# EAGLE design Multiplatform CVBS Processor (EAGLE 4.11)
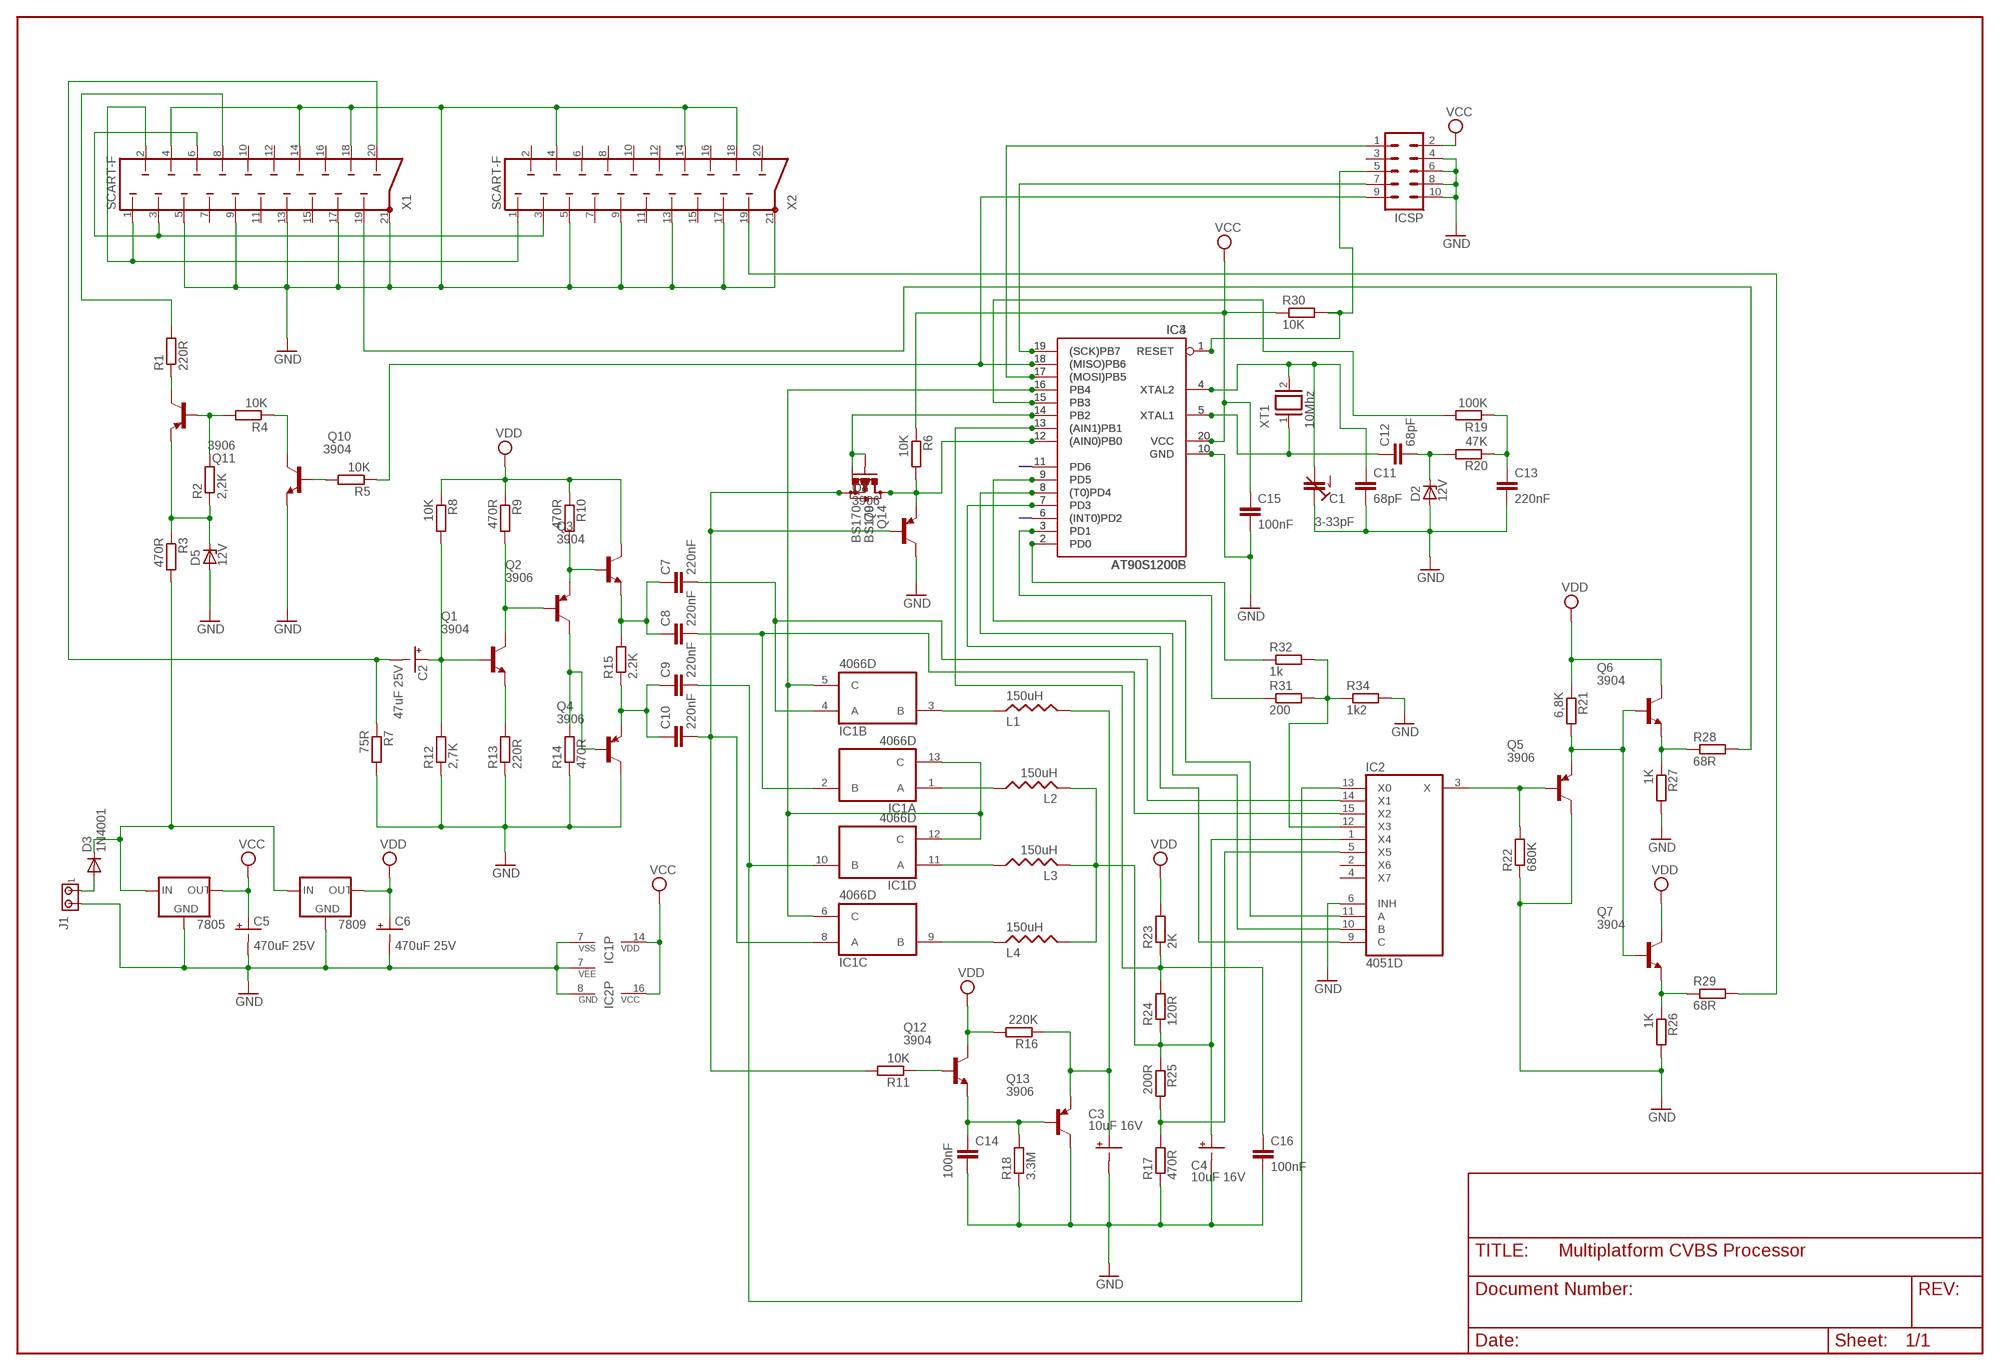
[diagram p0: schematic, sheet 1]

## Parts
7805  78XXS  [78XXS]
7809  78XXS  [78XXS]
C1  3-33pF  C-TRIMM808  [CTRIM808-BC]
C2  47uF 25V  CPOL-USE2-5  [E2-5]
C3  10uF 16V  CPOL-USE2-5  [E2-5]
C4  10uF 16V  CPOL-USE2-5  [E2-5]
C5  470uF 25V  CPOL-USE3.5-10  [E3,5-10]
C6  470uF 25V  CPOL-USE3.5-10  [E3,5-10]
C7  220nF  C-EUC1206K  [C1206K]
C8  220nF  C-EUC1206K  [C1206K]
C9  220nF  C-EUC1206K  [C1206K]
C10  220nF  C-EUC1206K  [C1206K]
C11  68pF  C-EUC1206K  [C1206K]
C12  68pF  C-EUC1206K  [C1206K]
C13  220nF  C-EUC1206K  [C1206K]
C14  100nF  C-EUC1206K  [C1206K]
C15  100nF  C-EUC1206K  [C1206K]
C16  100nF  C-EUC1206K  [C1206K]
D2  12V  BZX84CSMD  [TO236]
D3  1N4001  1N4446  [DO35-10]
D5  12V  BZX84CSMD  [TO236]
IC1  4066D  [SO14]
IC2  4051D  [SO16]
IC3  AT90S1200P  [DIL20]
IC4  AT90S1200S  [SO20L]
ICSP  MA05-2  [MA05-2]
J1  MTA02-156  [1X2MTA]
L1  150uH  L-US0204V  [0204V]
L2  150uH  L-US0204V  [0204V]
L3  150uH  L-US0204V  [0204V]
L4  150uH  L-US0204V  [0204V]
Q1  3904  MMBT3904LT1-NPN-SOT23-BEC  [SOT23-BEC]
Q2  3906  MMBT3906LT1SMD  [SOT23-BEC]
Q3  3904  MMBT3904LT1-NPN-SOT23-BEC  [SOT23-BEC]
Q4  3906  MMBT3906LT1SMD  [SOT23-BEC]
Q5  3906  MMBT3906LT1SMD  [SOT23-BEC]
Q6  3904  MMBT3904LT1-NPN-SOT23-BEC  [SOT23-BEC]
Q7  3904  MMBT3904LT1-NPN-SOT23-BEC  [SOT23-BEC]
Q8  3906  MMBT3906LT1SMD  [SOT23-BEC]
Q9  BS170  BSS123  [SOT23]
Q10  3904  MMBT3904LT1-NPN-SOT23-BEC  [SOT23-BEC]
Q11  3906  MMBT3906LT1SMD  [SOT23-BEC]
Q12  3904  MMBT3904LT1-NPN-SOT23-BEC  [SOT23-BEC]
Q13  3906  MMBT3906LT1SMD  [SOT23-BEC]
Q14  BS170  [SOT54E]
R1  220R  R-EU_R0805W  [R0805W]
R2  2,2K  R-EU_R0805W  [R0805W]
R3  470R  R-EU_R0805W  [R0805W]
R4  10K  R-EU_R0805W  [R0805W]
R5  10K  R-EU_R0805W  [R0805W]
R6  10K  R-EU_R0805W  [R0805W]
R7  75R  R-EU_R0805W  [R0805W]
R8  10K  R-EU_R0805W  [R0805W]
R9  470R  R-EU_R0805W  [R0805W]
R10  470R  R-EU_R0805W  [R0805W]
R11  10K  R-EU_R0805W  [R0805W]
R12  2,7K  R-EU_R0805W  [R0805W]
R13  220R  R-EU_R0805W  [R0805W]
R14  470R  R-EU_R0805W  [R0805W]
R15  2.2K  R-EU_R0805W  [R0805W]
R16  220K  R-EU_R0805W  [R0805W]
R17  470R  R-EU_R0805W  [R0805W]
R18  3.3M  R-EU_R0805W  [R0805W]
R19  100K  R-EU_R0805W  [R0805W]
R20  47K  R-EU_R0805W  [R0805W]
R21  6,8K  R-EU_R0805W  [R0805W]
R22  680K  R-EU_R0805W  [R0805W]
R23  2K  R-EU_R0805W  [R0805W]
R24  120R  R-EU_R0805W  [R0805W]
R25  200R  R-EU_R0805W  [R0805W]
R26  1K  R-EU_R0805W  [R0805W]
R27  1K  R-EU_R0805W  [R0805W]
R28  68R  R-EU_R0805W  [R0805W]
R29  68R  R-EU_R0805W  [R0805W]
R30  10K  R-EU_R0805W  [R0805W]
R31  200  R-EU_R0805W  [R0805W]
R32  1k  R-EU_R0805W  [R0805W]
R34  1k2  R-EU_R0805W  [R0805W]
X1  SCART-F  [SCART-F]
X2  SCART-F  [SCART-F]
XT1  10Mhz  XTAL/S  [QS]

## Nets
GND: 7805.GND 7809.GND C1.1(E) C3.- C4.- C5.- C6.- C11.2 C13.2 C14.2 C15.2 C16.2 D2.A D5.A IC1.7(P:VSS) IC2.6(INH) IC2.7(VEE) IC2.8(GND) IC3.10(GND) IC4.10(GND) ICSP.4 ICSP.6 ICSP.8 ICSP.10 J1.2 Q4.C Q5.C Q8.C Q10.E Q13.C R7.2 R12.1 R13.1 R14.1 R17.1 R18.1 R22.1 R26.2 R27.2 R34.2 X1.4 X1.5 X1.9 X1.13 X1.14 X1.17 X1.18 X1.21 X2.4 X2.5 X2.9 X2.13 X2.14 X2.17 X2.18 X2.21
N$1: X1.1 X1.2 X2.1
N$2: C3.+ L1.1 Q13.E R16.1
N$3: X1.3 X1.6 X2.3
N$4: Q2.C Q4.B R14.2
N$5: R1.2 X1.8
N$6: Q11.C R1.1
N$7: Q1.E R13.2
N$8: Q11.B R2.2 R4.2
N$9: Q6.E R27.1 R28.1
N$10: D5.C Q11.E R2.1 R3.1
N$11: C16.1 IC3.13((AIN1)PB1) IC4.13((AIN1)PB1) R23.1 R24.2
N$12: IC2.9(C) IC3.7(PD3) IC4.7(PD3)
N$13: Q10.C R4.1
N$14: Q10.B R5.2
N$15: IC3.18((MISO)PB6) IC4.18((MISO)PB6) ICSP.9 R5.1
N$16: IC3.14(PB2) IC4.14(PB2) Q9.1(G) Q14.G
N$17: IC2.5(X5) R17.2 R25.2
N$18: C8.2 IC1.2(A:B) IC2.15(X2)
N$19: C7.2 IC1.4(B:A) IC2.14(X1)
N$20: C2.+ Q1.B R8.2 R12.2
N$21: IC3.12((AIN0)PB0) IC4.12((AIN0)PB0) Q8.E Q9.3(D) Q14.D R6.2
N$22: C2.- R7.1 X1.20
N$23: IC2.10(B) IC3.8((T0)PD4) IC4.8((T0)PD4)
N$24: IC2.11(A) IC3.9(PD5) IC4.9(PD5)
N$25: Q7.E R26.1 R29.1
N$26: C9.2 IC1.10(D:B) IC2.13(X0)
N$27: R29.2 X2.19
N$28: Q5.E Q6.B Q7.B R21.2
N$29: Q2.E Q3.B R10.2
N$30: IC2.3(X) Q5.B R22.2
N$31: Q1.C Q2.B R9.2
N$32: D3.A J1.1
N$34: 7805.IN 7809.IN D3.C R3.2
N$37: C7.1 C8.1 Q3.E R15.2
N$38: C9.1 C10.1 Q4.E R15.1
N$41: R28.2 X1.19
N$42: IC3.1(RESET) IC4.1(RESET) ICSP.5 R30.2
N$43: IC1.5(B:C) IC1.6(C:C) IC1.12(D:C) IC1.13(A:C) IC3.16(PB4) IC4.16(PB4)
N$44: IC3.17((MOSI)PB5) IC4.17((MOSI)PB5) ICSP.1
N$45: IC3.19((SCK)PB7) IC4.19((SCK)PB7) ICSP.7
N$46: IC1.3(B:B) L1.2
N$47: IC1.9(C:B) L4.2
N$48: IC1.11(D:A) L3.1
N$49: IC1.1(A:A) L2.1
N$50: C4.+ IC2.1(X4) L2.2 L3.2 L4.1 R24.1 R25.1
N$51: IC3.2(PD0) IC4.2(PD0) R32.1
N$52: Q12.B R11.1
N$53: C10.2 IC1.8(C:A) Q8.B Q9.2(S) Q14.S R11.2
N$54: IC3.3(PD1) IC4.3(PD1) R31.1
N$55: IC3.15(PB3) IC4.15(PB3) R19.2
N$56: C13.1 R19.1 R20.1
N$57: IC3.11(PD6) IC4.11(PD6)
N$58: C12.2 D2.C R20.2
N$59: C12.1 IC3.5(XTAL1) IC4.5(XTAL1) XT1.1
N$60: C1.2(A) C11.1 IC3.4(XTAL2) IC4.4(XTAL2) XT1.2
N$61: IC2.12(X3) R31.2 R32.2 R34.1
N$62: IC3.6((INT0)PD2) IC4.6((INT0)PD2)
N$68: C14.1 Q12.E Q13.B R18.2
VCC: 7805.OUT C5.+ C15.1 IC1.14(P:VDD) IC2.16(VCC) IC3.20(VCC) IC4.20(VCC) ICSP.2 R6.1 R30.1
VDD: 7809.OUT C6.+ Q3.C Q6.C Q7.C Q12.C R8.1 R9.1 R10.1 R16.2 R21.1 R23.2
Unconnected: IC2.2(X6) IC2.4(X7) ICSP.3 X1.7 X1.10 X1.11 X1.12 X1.15 X1.16 X2.2 X2.6 X2.7 X2.8 X2.10 X2.11 X2.12 X2.15 X2.16 X2.20

## Buses
B$1
B$2

## Library data of the parts
7805 7809 = v-reg:78XXS: VOLTAGE REGULATOR
C1 = rcl:C-TRIMM: Trimm capacitor
C2-C6 = rcl:CPOL-US: POLARIZED CAPACITOR, American symbol
C7-C16 = rcl:C-EU: CAPACITOR, European symbol
D2 D5 = diode:BZX84CSMD: Z DIODE
D3 = diode:1N4446: DIODE high speed (Philips)
IC1 = 40xx:4066: Quad bilateral ANALOG SWITCH
IC2 = 40xx:4051: 8-channel ANALOG MULTIPLEXER
IC3 IC4 = atmel:AT90S1200: MICROCONTROLLER 1 Kbytes FLASH 64 bytes EEPROM
ICSP = con-lstb:MA05-2: PIN HEADER
J1 = con-amp:MTA02-156: AMP connector
L1-L4 = rcl:L-US: INDUCTOR, American symbol
Q1 Q3 Q6 Q7 Q10 Q12 = transistor:*-NPN-: NPN Transistror
Q2 Q4 Q5 Q8 Q11 Q13 = transistor-pnp:MMBT3906*: PNP Transistror
Q9 = transistor-small-signal:BSS123: N-CHANNEL MOS FET
Q14 = transistor-small-signal:BS170: N-CHANNEL MOS FET
R1-R32 R34 = rcl:R-EU_: RESISTOR, European symbol
X1 X2 = con-hirschmann:SCART-F: TV SCART CONNECTOR
XT1 = special:XTAL/S: CRYSTAL

## Net classes
0 default: width 0.5 mm, drill 0.3 mm

## Board
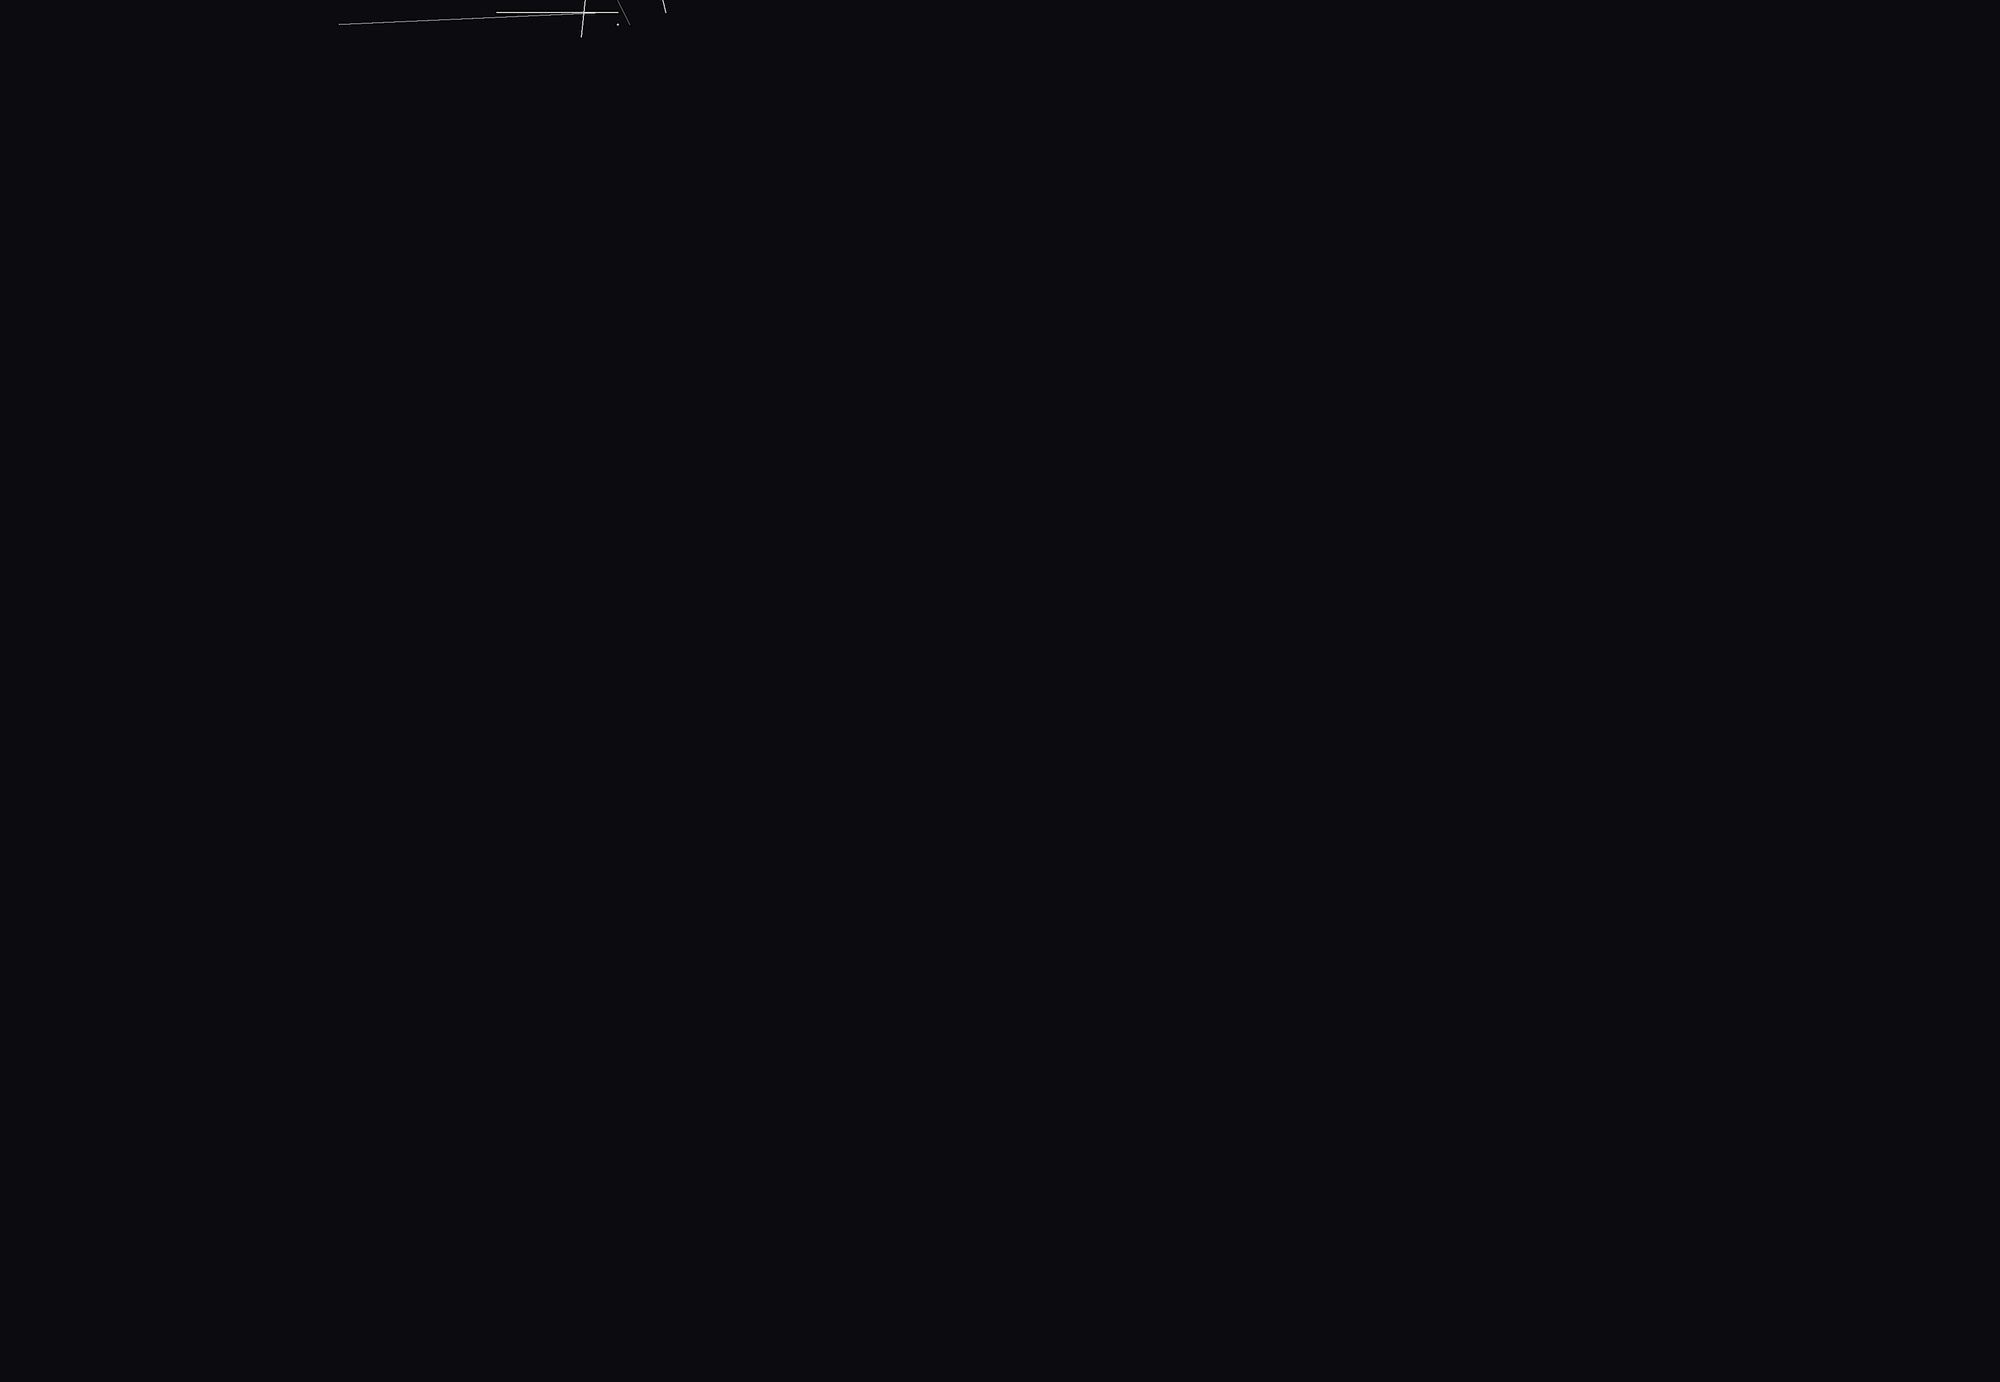
[diagram p1: board, top side]
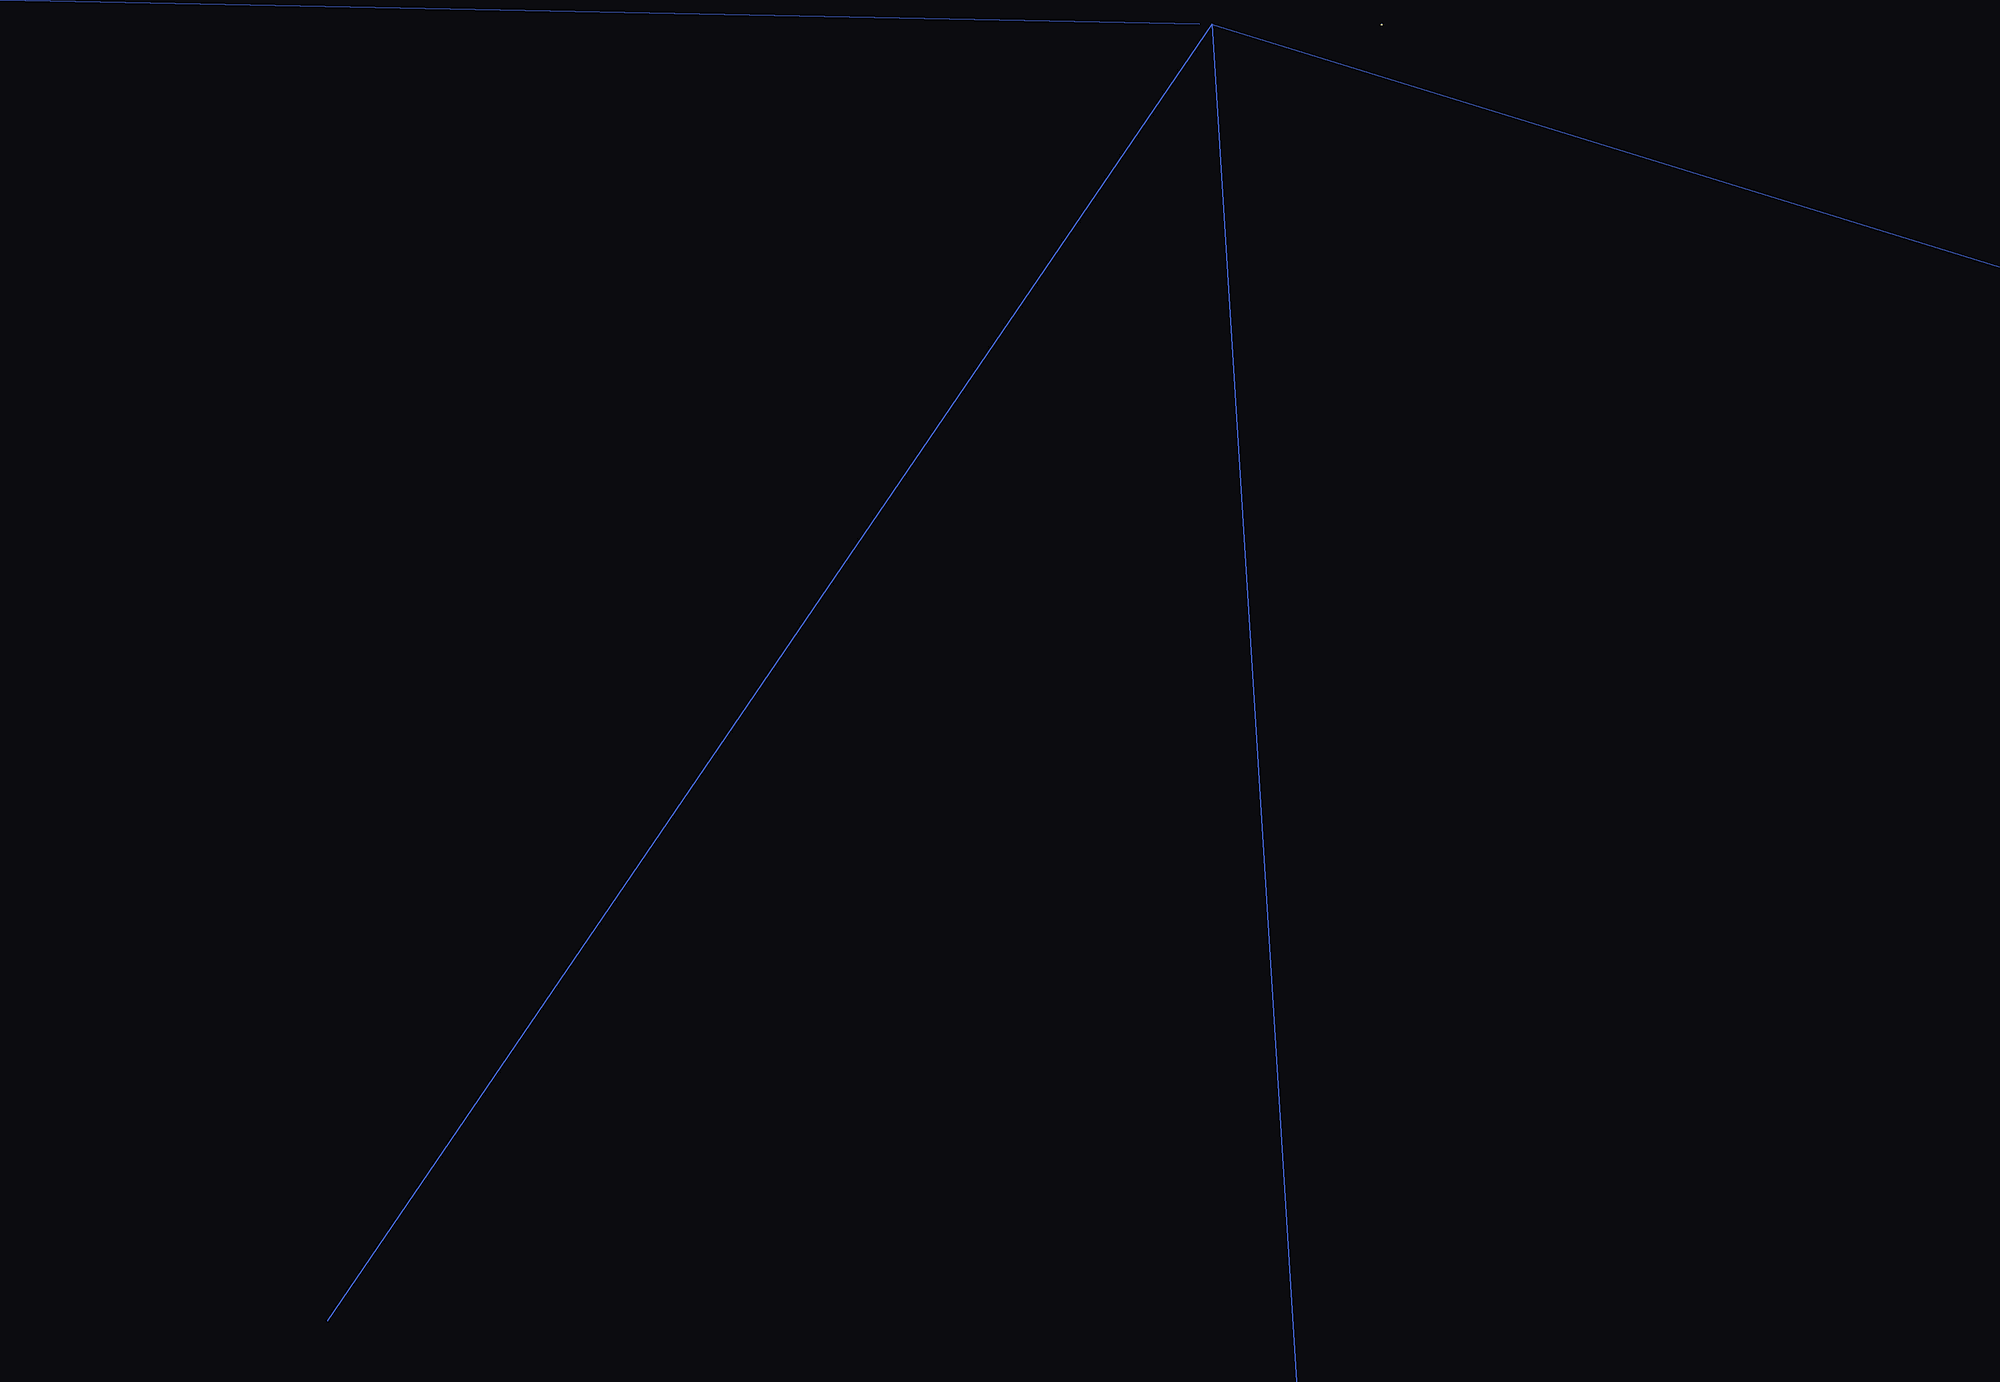
[diagram p2: board, bottom side, seen from below]

Size 70.68 x 88.87 mm. Coordinates in mm from the lower left corner, seen from the top.
Outline: 0.07,0 70.68,0.04 70.59,88.87 0,88.87 0.07,0
Copper layers (1*16): Top 0.035mm / dielectric 1.5mm / Bottom 0.035mm
Design rules "10mils": minimum track width 10mil, minimum drill 24mil, track to track 10mil, track to pad 10mil, pad to pad 10mil, via to via 10mil, smd to smd 10mil, copper to edge 40mil, drill to drill 10mil, minimum pad ring 10mil, minimum via ring 8mil, stop-mask expansion 0mil, vias tented up to drill 0mil, thermal gap 10mil
Holes 3.81 mm at 6.08,58.02 64.5,58.02
Holes 6.45 mm at 6.04,5.58 64.31,5.62
vRestrict: area 42.1,24.6 to 52.5,29.4

### Footprints (pad centres in the part's own frame; a part is rotated, then mirrored left to right if it is on the bottom)
78XXS = drill 1.016 long: GND 0,-2.54; IN -2.54,-2.54; OUT 2.54,-2.54
CTRIM808-BC = drill 1.3 round: 1 -3.607,0; 2 0,3.607; 3 3.607,0
E2-5 = drill 0.813 pad 1.27 round: + -1.016,0 | drill 0.813 pad 1.27 octagon: - 1.016,0
E3,5-10 = drill 0.813 pad 1.6 round: + -1.778,0 | drill 0.813 pad 1.6 octagon: - 1.778,0
C1206K = smd 1.5 x 2: 1 -1.5,0; 2 1.5,0
TO236 = smd 1 x 1.2: A -1,-1; C 0,1; NC 1,-1
DO35-10 = drill 0.813 long: A 5.08,0; C -5.08,0
SO14 = smd 0.66 x 2.032: 1 -3.81,-3.073; 2 -2.54,-3.073; 3 -1.27,-3.073; 4 0,-3.073; 5 1.27,-3.073; 6 2.54,-3.073; 7 3.81,-3.073; 8 3.81,3.073; 9 2.54,3.073; 10 1.27,3.073; 11 0,3.073; 12 -1.27,3.073; 13 -2.54,3.073; 14 -3.81,3.073
SO16 = smd 0.66 x 2.032: 1 -4.445,-3.073; 2 -3.175,-3.073; 3 -1.905,-3.073; 4 -0.635,-3.073; 5 0.635,-3.073; 6 1.905,-3.073; 7 3.175,-3.073; 8 4.445,-3.073; 9 4.445,3.073; 10 3.175,3.073; 11 1.905,3.073; 12 0.635,3.073; 13 -0.635,3.073; 14 -1.905,3.073; 15 -3.175,3.073; 16 -4.445,3.073
DIL20 = drill 0.813 long: 1 -11.43,-3.81; 2 -8.89,-3.81; 3 -6.35,-3.81; 4 -3.81,-3.81; 5 -1.27,-3.81; 6 1.27,-3.81; 7 3.81,-3.81; 8 6.35,-3.81; 9 8.89,-3.81; 10 11.43,-3.81; 11 11.43,3.81; 12 8.89,3.81; 13 6.35,3.81; 14 3.81,3.81; 15 1.27,3.81; 16 -1.27,3.81; 17 -3.81,3.81; 18 -6.35,3.81; 19 -8.89,3.81; 20 -11.43,3.81
SO20L = smd 0.762 x 1.143: 1 -5.08,-5.131; 2 -3.81,-5.131; 3 -2.54,-5.131; 4 -1.27,-5.131; 5 0,-5.131; 6 1.27,-5.131; 7 2.54,-5.131; 8 3.81,-5.131; 9 5.08,-5.131; 10 6.35,-5.131; 11 6.35,4.369; 12 5.08,4.394; 13 3.81,4.394; 14 2.54,4.394; 15 1.27,4.394; 16 0,4.394; 17 -1.27,4.394; 18 -2.54,4.394; 19 -3.81,4.394; 20 -5.08,4.394
MA05-2 = drill 1.016 octagon: 1 -5.08,-1.27; 2 -5.08,1.27; 3 -2.54,-1.27; 4 -2.54,1.27; 5 0,-1.27; 6 0,1.27; 7 2.54,-1.27; 8 2.54,1.27; 9 5.08,-1.27; 10 5.08,1.27
1X2MTA = drill 1.676 long: 1 1.981,0; 2 -1.981,0
0204V = drill 0.813 octagon: 1 -1.27,0; 2 1.27,0
SOT23-BEC = smd 1 x 1.4: B -0.95,-1.1; C 0,1.1; E 0.95,-1.1
SOT23 = smd 1 x 1.4: 1 -0.95,-1.1; 2 0.95,-1.1; 3 0,1.1
SOT54E = drill 0.813 octagon: D -1.27,0; G 0,1.905; S 1.27,0
R0805W = smd 1.5 x 1: 1 -0.94,0; 2 0.94,0
SCART-F = drill 1.321 long: 1 19.05,3.81; 2 17.145,-1.27; 3 15.24,3.81; 4 13.335,-1.27; 5 11.43,3.81; 6 9.525,-1.27; 7 7.62,3.81; 8 5.715,-1.27; 9 3.81,3.81; 10 1.905,-1.27; 11 0,3.81; 12 -1.905,-1.27; 13 -3.81,3.81; 14 -5.715,-1.27; 15 -7.62,3.81; 16 -9.525,-1.27; 17 -11.43,3.81; 18 -13.335,-1.27; 19 -15.24,3.81; 20 -17.145,-1.27; 21 -19.05,3.81
QS = drill 0.61 round: 1 -2.54,0; 2 2.54,0

### Placement (x,y rotation side)
7805  14.32,10.12 0 top
7809  14.28,17.62 0 top
C1  64.98,27.47 90 top
C2  56.24,84.05 90 top
C3  22.56,26.81 180 top
C4  22.45,20.79 0 top
C5  31.02,24.14 90 top
C6  7.49,26.96 180 top
C7  47.35,63.73 90 top
C8  44.18,63.73 90 top
C9  47.35,55.16 90 top
C10  44.18,55.16 90 top
C11  55.42,27.04 0 top
C12  39.53,26.96 180 top
C13  65.77,16 180 top
C14  38.66,32.8 270 top
C15  65.77,19.81 180 top
C16  30.52,16.36 270 top
D2  65.58,36.36 0 top
D3  21.09,10.7 270 top
D5  7.04,84 0 top
IC1  35.29,63.1 0 top
IC2  34.65,52.94 0 top
IC3  49.26,18.78 180 top
IC4  49.99,14.2 180 top
ICSP  49.46,6.16 180 top
J1  29.52,7.73 180 top
L1  16.87,60.08 0 top
L2  17,55.83 180 top
L3  17,52.66 180 top
L4  16.87,63.25 0 top
Q1  54.34,61.83 270 top
Q2  54.34,55.16 90 top
Q3  57.51,50.08 270 top
Q4  51.8,50.08 90 top
Q5  35.29,84.05 0 top
Q6  42.91,84.05 0 top
Q7  61.32,84.05 0 top
Q8  27,16.19 0 top
Q9  38.57,8.49 90 top
Q10  14.2,84.22 0 top
Q11  24.49,84.05 0 top
Q12  42.47,33.01 0 top
Q13  31.92,32.8 0 top
Q14  38.86,3.7 0 top
R1  28.3,84.05 270 top
R2  20.63,84.1 270 top
R3  3.54,84.05 270 top
R4  17.65,84.1 270 top
R5  10.39,84.14 90 top
R6  25.92,32.79 270 top
R7  51.8,84.05 270 top
R8  57.51,65.64 180 top
R9  58.78,61.83 270 top
R10  58.78,55.16 270 top
R11  45.65,32.8 90 top
R12  51.8,65.64 0 top
R13  50.52,61.83 270 top
R14  50.52,55.16 270 top
R15  45.45,50.08 180 top
R16  28.51,32.8 90 top
R17  55.81,32.8 90 top
R18  35.49,32.8 90 top
R19  65.77,12.32 180 top
R20  61.88,36.42 90 top
R21  39.09,84.05 270 top
R22  31.73,84.05 270 top
R23  48.19,32.8 90 top
R24  50.73,32.8 90 top
R25  53.27,32.8 90 top
R26  64.5,84.05 270 top
R27  49.26,84.05 270 top
R28  46.72,84.05 270 top
R29  67.03,84.05 270 top
R30  57.27,6.03 90 top
R31  17.89,32.6 90 top
R32  23.35,32.81 270 top
R34  20.37,32.69 90 top
X1  35.29,74.53 180 bottom
X2  35.29,44.05 180 bottom
XT1  47.33,27.06 0 top

### Tracks (layer width: path | path; a pad name or v marks a point on that pad's centre or on a via)
GND  (via drill 0.61)
  Top 0.406: IC3.10 37.82,20.88 39.31,19.39 43.58,19.39 43.64,19.45 | 43.64,19.45 43.67,19.48 | 43.64,19.45 IC4.10
  Top 0.5: v8.3,24.03 8.94,23.35 8.94,20.35 11.64,17.65 12.39,17.65 13.59,16.45 7809.GND | 7805.GND 13.89,9.25 13.89,13.45 7809.GND | 64.29,17.95 64.29,18.85 C15.2 | 64.29,17.95 64.29,16.9 C13.2 64.29,15.1 64.29,14.2 64.14,14.05 63.24,14.05 62.94,13.75 62.94,13.15 61.74,11.95 61.14,11.95 60.24,11.05 60.24,9.59 v59.01,8.44 | 64.29,17.95 68.78,17.95 68.79,18.85 68.79,22.15 v67.29,23.65 66.99,24.25 66.99,33.4 66.69,33.7 64.74,33.7 64.59,33.85 | 64.59,33.85 64.59,34.9 D2.A | 64.59,33.85 64.44,33.7 58.59,33.7 | 57.09,32.2 56.34,31.45 56.19,31.45 R17.1 | 58.59,33.7 57.09,32.2 | v56.64,29.05 57.24,28.45 57.24,28 C11.2 | 57.09,32.2 v57.39,31.9 | v25.29,19.45 25.74,19 26.79,19 26.94,18.85 26.94,17.95 Q8.C | C5.- 31.29,25.15 31.44,25 33.54,25 34.74,23.8 v34.74,23.2 35.04,22.6 35.19,22.45 35.19,18.55 v35.34,18.4 | ICSP.4 51.24,4.6 50.34,4.6 ICSP.6 48.69,4.6 47.79,4.6 ICSP.8 46.14,4.6 45.24,4.6 ICSP.10 43.89,5.65 42.69,6.85 42.69,9.55 41.49,10.75 35.94,10.75 v35.49,10.3 32.34,13.45 32.34,14.8 31.44,14.8 C16.2 | v19.66,28.33 19.27,28.06 17.92,26.71 17.92,25.42 18.54,24.84 18.54,13.45 17.79,12.7 15.84,12.7 14.94,13.6 7809.GND | 20.34,35.95 20.34,34.3 R34.2 | 20.34,35.95 23.04,38.65 X2.17 | X2.21 17.19,38.8 17.49,38.8 20.34,35.95 | X2.18 22.29,43.3 23.49,42.1 X2.17 | Q4.C 50.04,50.05 49.44,50.05 48.84,49.45 48.84,47.35 X2.4 48.22,43.8 46.74,42.07 X2.5 45.69,41.65 45.09,41.65 44.19,42.55 44.04,42.55 43.59,43 42.09,43 41.19,42.1 40.29,42.1 39.99,41.8 X2.9 | 37.89,48.1 36.54,48.1 36.54,49 IC2.6 | 37.89,48.1 37.89,49 IC2.7 | 39.09,48.1 IC2.8 | 39.09,48.1 37.89,48.1 | X2.9 39.09,48.1
  Top 0.5: C14.2 37.74,31.3 35.94,31.3 R18.1 35.04,32.05 33.84,33.25 32.34,33.25 Q13.C 31.89,34.6 v31.89,35.95 | X2.9 38.19,41.8 37.29,41.8 36.09,43 34.59,43 33.69,42.1 32.94,42.1 32.49,41.65 X2.13 30.99,42.25 29.94,43.3 X2.14 28.59,43.9 27.99,43.3 27.24,43.3 26.49,42.55 26.34,42.55 25.44,41.65 24.84,41.65 X2.17 | R27.2 49.74,82.6 51.39,82.6 R7.2 52.14,83.05 v53.34,83.05 | v54.84,79.45 55.29,79.9 60.54,79.9 60.99,80.35 63.84,80.35 64.44,80.95 64.44,82.45 R26.2 | R13.1 50.49,63.4 50.49,65.2 R12.1 | v51.09,59.05 51.09,57.55 50.49,56.95 50.49,56.8 R14.1 | R12.1 50.19,65.65 49.29,65.65 49.14,65.8 49.14,66.55 47.04,68.65 X1.5 47.19,72.7 48.24,73.75 X1.4 | v52.29,68.5 52.29,67.9 51.09,66.7 51.09,66.1 R12.1 | v9.09,80.8 6.24,80.8 6.09,80.95 6.09,82.45 D5.A | v11.79,80.8 14.94,80.8 15.09,80.95 | 15.09,80.95 15.09,82.45 Q10.E | X1.21 17.19,72.25 17.94,72.25 18.84,73.15 18.99,73.15 20.19,74.35 20.94,74.35 X1.18 | X1.18 22.29,73.75 23.34,72.7 X1.17 24.84,72.1 25.44,72.1 27.24,73.9 28.14,73.9 28.59,74.35 X1.14 | 15.09,80.95 15.24,80.8 17.34,80.8 20.94,77.2 X1.18 | v40.74,62.5 40.14,62.5 39.24,61.6 39.09,61.6 IC1.7 | R22.1 31.74,85.6 31.74,86.35 35.34,86.35 35.34,85.75 Q5.C 35.64,84.55 37.14,84.55 37.44,84.25 37.44,81.25 36.39,80.2 32.64,80.2 30.09,77.65 X1.14 | X1.14 29.94,73.75 30.99,72.7 X1.13 32.49,72.1 32.94,72.55 33.54,72.55 34.44,73.45 36.09,73.45 37.29,72.25 38.19,72.25 X1.9 | v12.69,41.05 9.99,41.05 7.44,43.6 7.44,46.45 9.54,48.55 9.54,53.95 10.49,54.9 10.54,63.95 v13.89,67.3 | v61.14,41.8 57.99,38.65 57.99,37 58.44,36.55 58.44,33.85 58.59,33.7
  Bottom 0.5: v8.3,24.03 6.57,24.05 C6.- | v67.29,23.65 65.4,23.73 64.98,23.98 C1.1 | v56.64,29.05 57.09,29.5 57.09,31.6 v57.39,31.9 | v25.29,19.45 24.24,20.5 C4.- | C4.- 23.19,21.55 23.19,22 21.84,23.35 21.84,26.05 C3.- 20.79,27.1 20.04,27.85 v19.66,28.33 | C5.- 30.24,25.6 28.59,25.6 24.09,21.1 C4.- | v34.74,23.2 37.14,23.2 IC3.10 | v35.49,10.3 33.39,10.3 32.64,9.55 J1.2 30.84,10 29.64,11.2 29.64,12.25 30.54,13.15 30.69,13.15 35.34,17.8 v35.34,18.4 | v59.01,8.44 60.24,7.6 60.24,4.9 57.99,2.65 53.34,2.65 52.44,3.55 52.44,4.15 ICSP.4 | v31.89,35.95 31.89,38.2 X2.13 | v53.34,83.05 53.34,82.75 54.84,81.25 v54.84,79.45 55.14,78.85 55.29,78.7 55.29,75.1 52.29,72.1 v52.29,68.5 | v11.79,80.8 v9.09,80.8 | v40.74,62.5 40.74,65.35 39.39,66.7 39.39,68.05 | 39.39,68.05 39.39,68.65 X1.9 | 39.39,68.05 43.89,68.05 45.09,69.25 45.69,69.25 X1.5 47.04,68.65 51.09,64.6 v51.09,59.05 51.39,58.6 57.39,52.6 57.39,52 58.29,51.1 58.29,47.35 60.69,44.95 60.69,42.25 v61.14,41.8 | v12.69,41.05 15.24,41.05 X2.21 | v13.89,67.3 15.54,68.95 X1.21
N$1
  Top 0.5: X2.1 54.54,42.25 54.54,42.55 55.29,43.3 55.29,44.05 61.29,50.05 61.29,65.65 57.69,69.25 55.29,69.25 X1.1 53.94,72.55 52.74,73.75 X1.2
N$2  (via drill 0.61)
  Top 0.5: 30.99,29.2 32.64,29.2 32.79,29.35 32.79,31.15 Q13.E | 30.99,29.2 28.59,29.2 28.44,29.35 28.44,31.15 R16.1 | v30.99,29.95 30.99,29.2 | v11.79,60.55 12.24,60.1 12.24,45.1 11.64,44.5 v11.04,44.5
  Bottom 0.5: 26.64,28.45 28.14,29.95 v30.99,29.95 | 26.64,28.45 25.44,27.25 24.24,27.25 C3.+ | v11.79,60.55 12.84,61.6 12.84,62.5 15.09,64.75 18.69,64.75 19.74,63.7 19.74,62.8 18.54,61.6 16.59,61.6 15.84,60.85 L1.1 | v11.04,44.5 9.54,43 9.54,37.45 10.59,36.4 11.94,36.4 14.19,34.15 17.94,34.15 20.94,31.15 23.94,31.15 26.64,28.45
N$3  (via drill 0.61)
  Top 0.5: v54.69,45.25 54.39,44.95 54.39,43.6 54.09,43.3 53.94,43.3 53.19,42.55 52.89,42.55 51.99,41.65 51.54,41.65 X2.3 | v57.84,44.8 57.84,45.4 62.19,49.75 62.19,53.15 v62.64,53.1
  Bottom 0.5: X1.6 45.84,77.2 46.29,77.2 47.64,78.55 49.44,78.55 50.49,77.5 50.49,72.7 X1.3 50.19,68.65 50.19,67.9 54.09,64 54.09,62.65 59.99,57.15 59.99,55.65 60.99,54.9 60.99,54.02 62.04,52.97 v62.64,53.1 | v54.69,45.25 55.14,44.8 v57.84,44.8
N$4
  Top 0.5: 53.79,52.75 53.79,54.7 Q2.C | 53.79,52.75 54.39,52.15 54.39,49.75 53.79,49.15 53.49,49.15 Q4.B | R14.2 50.79,53.5 50.79,53.2 51.69,52.3 53.34,52.3 53.79,52.75
N$5  (via drill 0.61)
  Top 0.5: v27.69,80.8 28.14,80.8 28.29,80.95 28.29,82.45 R1.2 | v21.99,68.65 22.44,68.65 23.19,67.9 28.89,67.9 v29.49,68.5
  Bottom 0.5: v27.69,80.8 26.79,80.8 23.79,77.8 23.79,74.2 21.84,72.25 21.84,68.8 v21.99,68.65 | v29.49,68.5 29.49,72.25 31.44,74.2 31.44,77.35 32.94,78.85 39.54,78.85 40.59,77.8 X1.8
N$6
  Top 0.5: Q11.C 24.54,85.75 24.54,87.1 24.69,87.25 28.14,87.25 28.29,87.1 28.29,85.6 R1.1
N$7
  Top 0.5: Q1.E 52.59,60.85 50.94,60.85 R13.2
N$8
  Top 0.5: Q11.B 23.49,82.3 23.49,80.8 23.34,80.65 20.79,80.65 20.64,80.8 20.64,82.45 R2.2 20.19,82.45 18.09,82.45 R4.2
N$9
  Top 0.5: Q6.E 44.34,83.65 45.39,84.7 46.29,84.7 R28.1 46.74,85.6 46.74,87.1 46.89,87.25 49.14,87.25 49.29,87.1 49.29,85.6 R27.1
N$10  (via drill 0.61)
  Top 0.5: 6.99,87.1 6.99,85.45 D5.C | 6.99,87.1 6.84,87.25 3.69,87.25 3.54,87.1 3.54,85.6 R3.1 | v19.14,81.1 20.49,79.75 23.64,79.75 24.09,80.2 25.14,80.2 25.44,80.5 25.44,82.3 Q11.E | v22.14,84.25 21.69,84.7 21.09,84.7 R2.1 20.64,85.75 20.64,87.1 20.49,87.25 7.14,87.25 6.99,87.1
  Bottom 0.5: v19.14,81.1 19.14,81.85 21.54,84.25 v22.14,84.25
N$11  (via drill 0.61)
  Top 0.406: IC3.13 43.43,14.45 43.43,13.58 44.6,12.41 45.36,12.41 46.18,11.58 IC4.13
  Top 0.5: R23.1 48.54,32.35 48.99,32.35 50.34,33.7 R24.2 50.79,34.45 50.79,35.2 50.64,35.35 v49.59,35.35 | v36.09,12.25 34.74,12.25 33.24,13.75 33.24,16 32.19,17.05 32.19,17.65 31.89,17.95 31.44,17.95 C16.1 29.64,18.25 27.54,20.35 v26.94,20.35
  Bottom 0.5: v36.09,12.25 36.69,12.25 36.84,12.4 40.89,12.4 42.24,13.75 IC3.13 | v49.59,35.35 44.49,30.25 42.54,30.25 40.44,28.15 37.91,28.15 36.73,30.13 35.16,30.13 34.94,30.09 33.97,29.17 33.97,27.94 34.74,27.24 34.74,25.9 32.79,23.95 29.94,23.95 29.49,24.4 28.59,24.4 27.69,23.5 27.69,21.1 v26.94,20.35
N$12  (via drill 0.61)
  Top 0.406: IC4.7 47.03,19.74 47.03,20.32 45.45,21.91 IC3.7
  Top 0.5: v41.79,52.9 41.19,52.9 39.69,54.4 39.09,54.4 IC2.9 | v33.39,26.35 36.09,23.65 36.09,21.1 36.84,20.35 37.14,20.35 38.94,18.55 41.79,18.55 42.54,17.8 47.34,17.8 47.49,17.95 47.49,18.85 IC4.7
  Bottom 0.5: v41.79,52.9 41.34,53.35 39.99,53.35 35.49,48.85 34.89,48.85 34.14,48.1 32.64,48.1 31.44,46.9 31.44,43.75 29.49,41.8 29.49,38.65 28.44,37.6 27.54,37.6 26.19,36.25 26.19,34.75 29.64,31.3 31.44,31.3 32.49,30.25 32.49,27.25 v33.39,26.35
N$13
  Top 0.5: R4.1 17.64,85.75 17.64,86.35 14.19,86.35 14.19,85.9 Q10.C
N$14
  Top 0.5: R5.2 10.74,84.7 11.94,84.7 12.84,83.8 Q10.B
N$15  (via drill 0.61)
  Top 0.406: IC4.18 52.53,10.5 54.12,12.09 55.26,12.09 55.66,12.48 55.66,14.91 55.6,14.96 IC3.18
  Top 0.5: v4.8,62.67 6.87,62.67 8.57,64.37 10.44,66.25 10.44,82.45 R5.1 | v2.19,54.75 2.64,54.3 2.64,24.25 9.84,17.05 9.84,6.1 12.24,3.7 12.99,3.7 13.29,3.4 20.04,3.4 21.39,2.05 v41.46,2.05
  Bottom 0.5: ICSP.9 44.94,7.9 49.89,12.85 54.09,12.85 54.99,13.75 IC3.18 56.19,13.75 57.09,12.85 58.14,12.85 62.04,9.69 62.17,9.55 66.25,9.57 68.82,7.46 68.82,3.94 66.1,1.7 42.63,1.7 42.24,2.05 v41.46,2.05 | v2.19,54.75 2.19,61.8 2.97,62.58 v4.8,62.67
N$16
  Top 0.406: IC3.14 45.44,13.72 47.49,11.68 47.49,9.84 IC4.14
  Top 0.5: Q9.1 39.09,7.15 39.09,6.25 Q14.G
  Bottom 0.5: Q14.G 39.24,6.25 41.64,8.65 41.64,8.95 45.69,13 45.69,13.45 IC3.14
N$17  (via drill 0.61)
  Top 0.5: R25.2 53.34,34.45 53.34,35.65 53.49,35.8 53.94,35.8 54.69,35.05 55.74,35.05 55.74,34.45 R17.2 55.44,33.7 54.69,32.95 54.69,31 52.44,28.75 41.34,28.75 40.59,29.5 v39.99,29.5 | v35.34,47.5 35.34,49 IC2.5
  Bottom 0.5: v35.34,47.5 35.34,47.2 35.19,47.05 35.19,43.9 37.14,41.95 37.14,32.35 v39.99,29.5
N$18  (via drill 0.61)
  Top 0.5: IC1.2 32.79,59.05 32.79,58.75 32.64,58.75 32.04,58.15 31.59,58.15 31.44,58 31.44,56.95 IC2.15 31.44,55 31.44,54.1 31.29,53.95 v30.99,53.95 | v40.44,60.1 42.09,61.75 42.09,64.6 42.69,65.2 43.29,65.2 C8.2
  Bottom 0.5: v40.44,60.1 35.64,55.3 32.94,55.3 31.59,53.95 v30.99,53.95
N$19  (via drill 0.61)
  Top 0.5: 35.34,58 35.19,57.85 32.94,57.85 32.79,57.7 32.79,56.95 IC2.14 | 35.34,58 35.34,59.05 IC1.4 | v46.59,67 46.59,65.95 C7.2 | v46.59,60.4 42.54,60.4 40.29,58.15 35.49,58.15 35.34,58
  Bottom 0.5: v46.59,60.4 v46.59,67
N$20  (via drill 0.61)
  Top 0.5: Q1.B 52.59,63.25 52.59,65.2 R12.2 53.34,65.65 54.69,65.65 | 54.69,65.65 55.89,65.65 R8.2 | 54.69,65.65 v54.69,65.5
  Bottom 0.5: v54.69,65.5 56.19,67 56.19,82.3 C2.+
N$21  (via drill 0.61)
  Top 0.406: IC3.12 40.98,14.36 40.98,13.3 41.62,12.66 42.9,12.66 43.98,11.58 44.53,11.58 44.85,11.26 44.85,9.86 IC4.12
  Top 0.5: 37.14,6.7 37.14,4.3 Q14.D | 37.14,6.7 37.14,8.05 Q9.3 | 27.99,13 27.99,14.5 Q8.E | 27.99,13 30.39,13 30.54,13.15 31.44,13.15 34.14,10.45 34.14,7.6 35.04,6.7 37.14,6.7 | 32.64,20.2 33.99,18.85 33.99,17.65 35.04,16.6 36.54,16.6 37.14,17.2 38.64,17.2 39.69,16.15 IC3.12 | 32.64,20.2 32.49,20.35 29.94,20.35 26.64,23.65 26.64,28 25.89,28.75 25.89,31.15 R6.2 | v23.68,7.62 23.63,9.28 27.39,13 27.99,13 | v32.94,20.5 32.64,20.2
  Bottom 0.5: v23.68,7.62 23.55,10.09 22.89,10.6 21.99,11.5 21.99,12.55 22.59,13.15 22.74,13.15 24.84,15.25 26.19,15.25 26.94,16 29.34,16 32.19,18.85 32.19,19.15 32.94,19.9 v32.94,20.5
N$22  (via drill 0.61)
  Top 0.5: R7.1 51.84,85.6 v51.84,86.8 51.84,87.1 51.99,87.25 54.39,87.25 55.89,85.75 C2.- | v29.79,85 29.79,85.9 31.14,87.25 44.94,87.25 v45.39,86.8
  Bottom 0.5: v29.79,85 24.24,79.45 20.79,79.45 18.84,77.5 X1.20 | v45.39,86.8 45.84,87.25 51.39,87.25 v51.84,86.8
N$23  (via drill 0.61)
  Top 0.305: IC4.8 44.31,21.2 42.9,21.2
  Top 0.406: IC3.8 42.86,22.64 42.83,22.64 42.83,21.27 42.9,21.2
  Top 0.5: v44.19,48.4 44.04,48.4 43.14,49.3 43.14,49.75 39.39,53.5 38.04,53.5 37.89,53.65 37.89,55 IC2.10 | v58.44,42.4 59.34,43.3 61.44,43.3 v62.94,41.8 | v59.47,25.07 58.14,25 v56.94,25
  Bottom 0.5: v44.19,48.4 44.49,48.1 45.54,48.1 46.59,47.05 46.59,43.9 47.94,42.55 49.29,42.55 49.74,43 51.24,43 51.69,42.55 53.19,42.55 54.54,43.9 56.94,43.9 v58.44,42.4 | v62.94,41.8 67.74,37 67.74,31 62.88,25.47 61.59,25.48 59.79,25.48 v59.47,25.07 | v56.94,25 55.89,24.95 50.79,24.95 50.47,24.96 49.27,24.96 48.9,24.84 46.35,24.84 45.54,24.85 44.64,24.85 43.59,23.8 IC3.8
N$24  (via drill 0.61)
  Top 0.305: IC4.9 44.73,19.46 44.45,20.17 44.22,20.4 40.87,20.4 40.5,20.76 40.5,22.73
  Top 0.406: 40.5,22.74 40.5,22.73 IC3.9
  Top 0.5: v36.69,52.6 36.54,52.75 36.54,55 IC2.11 | v12.69,39.25 13.14,38.8 13.14,37.3 12.69,36.85 12.69,30.7 11.94,29.95 v11.94,20.35 | v12.84,5.05 13.59,4.3 16.89,4.3 18.94,6.17 18.94,10.93 19.89,10.91 23.25,10.91 23.61,11.71 v23.71,11.58
  Bottom 0.5: v36.69,52.6 35.79,51.7 35.79,51.55 34.89,50.65 34.29,50.65 32.94,49.3 32.64,49.3 31.44,48.1 28.89,48.1 27.54,46.75 27.54,43.6 25.74,41.8 25.74,38.65 24.69,37.6 14.34,37.6 v12.69,39.25 | v11.94,20.35 11.94,19.6 9.09,16.75 9.11,9.08 10.2,8.29 10.15,6.16 11.34,5.05 v12.84,5.05 | v23.71,11.58 23.62,12.91 25.14,14.35 26.49,14.35 27.24,15.1 29.64,15.1 33.09,18.55 33.09,18.85 34.59,20.35 38.64,20.35 39.69,21.4 IC3.9
N$25
  Top 0.5: Q7.E 62.64,83.65 62.64,84.1 63.24,84.7 64.14,84.7 R26.1 64.44,85.6 64.44,87.1 64.59,87.25 66.84,87.25 66.99,87.1 66.99,85.6 R29.1
N$26  (via drill 0.61)
  Top 0.5: v40.44,56.8 40.44,57.1 42.84,59.5 44.34,59.5 46.44,57.4 C9.2 | v33.99,53.95 33.99,55 IC2.13 | v36.54,64.15 36.54,65.2 IC1.10
  Bottom 0.5: v40.44,56.8 38.34,56.8 35.94,54.4 34.44,54.4 v33.99,53.95 33.39,54.25 33.24,54.4 31.44,52.6 30.54,52.6 29.64,53.5 29.64,56.05 35.34,61.75 37.59,61.75 38.34,62.5 38.94,62.5 39.84,63.4 39.84,64.3 38.94,65.2 37.59,65.2 v36.54,64.15
N$27  (via drill 0.61)
  Top 0.5: v63.57,51.5 67.64,54.32 67.64,59.87 65.94,61.57 64.58,61.57 63.45,62.46 63.45,66.16 57.94,71.66 57.94,77.31 58.83,78.29 65.81,78.29 66.99,79.15 66.99,82.45 R29.2
  Bottom 0.5: v63.57,51.5 61.57,51.5 59.92,53.15 59.92,54.25 58.99,54.65 58.99,56.9 53.19,62.32 53.19,63.7 48.54,68.35 48.54,72.4 47.49,73.45 45.84,73.45 45.54,73.15 43.89,73.15 43.59,73.45 42.09,73.45 41.79,73.15 40.14,73.15 39.84,73.45 38.34,73.45 38.04,73.15 36.39,73.15 36.09,73.45 34.59,73.45 33.24,72.1 33.24,69.1 30.39,66.25 26.04,66.25 25.29,67 24.39,67 22.29,64.9 22.29,55.9 21.09,54.7 21.09,53.8 21.99,52.9 23.49,52.9 23.94,53.35 24.84,53.35 25.74,52.45 25.74,51.55 22.29,48.1 21.24,48.1 20.04,46.9 X2.19
N$28  (via drill 0.61)
  Top 0.5: 40.14,80.8 41.79,80.8 | 40.14,80.8 39.24,80.8 39.09,80.95 R21.2 | 41.79,80.8 41.94,80.95 41.94,82.3 Q6.B | v31.59,81.1 36.09,81.1 36.24,81.25 36.24,82.3 Q5.E | v40.14,81.4 40.14,80.8 | Q7.B 60.39,82.3 60.39,80.95 60.24,80.8 52.89,80.8 51.84,79.75 51.69,79.9 42.54,79.9 41.79,80.65 41.79,80.8
  Bottom 0.5: v31.59,81.1 33.54,83.05 37.89,83.05 39.54,81.4 v40.14,81.4
N$29  (via drill 0.61)
  Top 0.5: Q3.B 57.09,51.4 58.44,51.4 58.74,51.7 v58.74,52.45 58.74,53.5 R10.2 | v56.04,57.7 56.49,57.25 56.49,56.05 56.04,56.05 Q2.E
  Bottom 0.5: v56.04,57.7 56.04,55.15 v58.74,52.45
N$30  (via drill 0.61)
  Top 0.5: Q5.B 34.29,82.3 34.29,82 32.64,82 32.19,82.45 R22.2 31.29,83.2 v30.09,83.2 | v24.39,52 32.64,52 32.79,51.85 32.79,50.8 IC2.3
  Bottom 0.5: v24.39,52 20.79,52 19.74,50.95 7.09,50.95 5.94,51.85 5.94,53.5 9.39,56.7 9.39,65.57 10.35,66.53 10.36,74.07 10.36,74.97 11.19,75.85 13.14,75.85 16.59,79.3 16.59,80.5 22.44,86.35 30.24,86.35 31.14,85.45 31.14,84.25 v30.09,83.2
N$31
  Top 0.5: Q2.B 56.04,54.25 57.24,54.25 57.39,54.4 57.39,57.55 58.74,58.9 58.74,60.25 R9.2 58.29,61 57.39,61.9 56.04,61.9 Q1.C
N$32
  Top 0.5: J1.1 26.34,5.95 23.34,2.95 21.69,2.95 20.97,4.45 20.98,4.38 D3.A
N$33
  Bottom 0.305: 23554.1,95.57 146024.44,-179420.66
N$34
  Top 0.5: R3.2 3.54,82.45 3.54,62.2 2.24,60.9 2.24,56.77 3.62,55.4 3.54,24.55 11.34,16.75 7809.IN 10.89,13.9 10.74,13.75 10.74,9.85 11.34,9.25 7805.IN
  Bottom 0.5: D3.C 20.34,14.65 19.59,14.65 17.64,12.7 12.99,12.7 12.24,13.45 7809.IN
N$35
  Bottom 0.305: 25231.82,98.36 191322.98,3453.78
N$36
  Bottom 0.406: 23553.55,95.36 11806.38,-187809.34
N$37  (via drill 0.61)
  Top 0.5: C8.1 45.09,62.2 46.44,62.2 C7.1 48.24,61.6 48.24,59.95 49.14,59.05 49.14,58.6 v49.74,58 | v47.79,51.4 44.79,51.4 44.64,51.25 44.64,50.5 R15.2 | v54.69,48.25 54.69,48.85 54.99,49.15 55.74,49.15 Q3.E
  Bottom 0.5: v54.69,48.25 53.79,49.15 49.44,49.15 47.79,50.8 v47.79,51.4 47.79,52 49.29,53.5 49.29,57.55 v49.74,58
N$38
  Top 0.5: C10.1 45.09,53.65 46.44,53.65 C9.1 48.24,53.05 49.74,51.55 49.74,51.4 | 49.74,51.4 49.29,51.4 49.14,51.25 49.14,50.95 48.24,50.05 47.04,50.05 R15.1 | 49.74,51.4 52.29,51.4 Q4.E
N$39
  Bottom 0.406: 23553.68,97.73 -85501.35,-33456.57
N$41  (via drill 0.61)
  Top 0.5: v45.39,81.7 46.74,81.7 46.74,82.45 R28.2 | v14.34,79.45 14.34,72.55 14.19,72.4 14.19,68.95 15.09,68.05 17.94,68.05 19.14,69.25 X1.19
  Bottom 0.5: v45.39,81.7 45.39,82.3 41.34,86.35 40.44,86.35 38.04,83.95 34.59,83.95 31.29,87.25 22.14,87.25 v14.34,79.45
N$42  (via drill 0.61)
  Top 0.406: IC4.1 58.21,19.33 60.73,21.84 60.73,22.53 60.79,22.59 | 60.79,22.59 60.79,22.6 | IC3.1 60.79,22.59
  Top 0.5: R30.2 57.24,7.6 57.24,9.25 57.84,9.25 v58.89,10.3 58.89,10.9 60.84,12.85 61.44,12.85 62.04,13.45 62.04,14.8 62.34,15.1 v62.34,19.45
  Bottom 0.5: v58.89,10.3 57.09,10.3 55.89,9.1 50.79,9.1 49.89,8.2 ICSP.5 | v62.34,19.45 60.99,20.8 60.99,21.1 IC3.1
N$43  (via drill 0.61)
  Top 0.406: IC3.16 50.52,12.14 50.06,11.67 50.06,10.14 49.99,10.07 IC4.16
  Top 0.5: IC1.13 32.94,65.2 33.69,65.2 IC1.12 33.99,65.2 33.99,63.55 34.14,63.4 35.49,63.4 36.54,62.35 36.54,61.6 | 36.54,61.6 36.54,61 IC1.5 | 37.89,61.6 36.54,61.6 | 37.89,61.6 37.89,61 IC1.6 | v62.64,61.28 62.19,61.48 62.19,65.95 56.19,71.95 56.19,75.55 53.19,78.55 51.69,78.55 51.24,78.1 49.89,78.1 48.99,79 48.09,79 46.59,77.5 46.59,74.05 44.79,72.25 44.79,68.5 39.84,63.55 39.84,63.4 38.94,62.5 38.04,62.5 37.89,62.35 37.89,61.6
  Bottom 0.5: v62.64,61.28 60.89,59.25 60.89,56.32 65.04,52.92 65.04,40.9 68.64,37.3 68.64,30.7 63.09,24.4 63.09,22 63.69,21.4 63.69,18.25 62.79,18.1 54.69,18.1 53.79,17.2 52.29,17.2 51.24,16.15 IC3.16
N$44  (via drill 0.61)
  Top 0.406: IC3.17 53.06,12.43 51.27,10.64 51.27,9.98 51.3,9.95 51.26,9.92 IC4.17
  Top 0.5: v58.89,6.55 60.09,6.55 60.09,7.64 61.34,8.82 61.32,10.54 v62.73,10.86
  Bottom 0.5: v58.89,6.55 58.44,7 55.29,7 ICSP.1 | v62.73,10.86 62.62,11.05 62.19,11.83 62.19,16.3 61.29,17.2 54.99,17.2 53.79,16 IC3.17
N$45  (via drill 0.61)
  Top 0.406: IC4.19 53.8,10.5 54.42,11.12 56.19,11.12 56.44,11.12 58.09,12.78 58.09,14.82 58.24,14.97 | 58.24,14.97 58.27,15 | 58.24,14.97 IC3.19
  Top 0.5: v56.19,11.2 56.19,11.12
  Bottom 0.5: v56.19,11.2 55.74,11.2 54.99,11.95 50.19,11.95 47.34,9.1 47.34,8.2 ICSP.7
N$46  (via drill 0.61)
  Top 0.5: v33.84,62.05 33.99,61.9 33.99,61 IC1.3 | v22.44,54.25 21.84,54.25 v20.34,55.75
  Bottom 0.5: v33.84,62.05 33.99,61.9 33.99,61.6 26.64,54.25 v22.44,54.25 | v20.34,55.75 20.34,56.35 20.19,56.5 20.19,58.45 18.84,59.8 L1.2
N$47  (via drill 0.61)
  Top 0.5: v36.69,68.2 37.74,68.2 37.89,68.05 37.89,67.15 IC1.9 | v24.84,65.65 24.39,66.1 22.59,66.1 22.44,66.25 20.64,66.25 18.39,64 L4.2
  Bottom 0.5: v36.69,68.2 36.24,68.2 36.09,68.05 33.39,68.05 30.69,65.35 25.14,65.35 v24.84,65.65
N$48
  Top 0.5: IC1.11 35.34,67.15 35.34,67.9 30.69,67.9 29.79,67 22.89,67 22.74,67.15 21.54,67.15 20.64,68.05 19.14,68.05 18.24,67.15 15.54,67.15 14.34,65.95 13.74,65.95 12.24,64.45 12.24,61.9 13.14,61 13.14,53.2 15.39,50.95 17.64,50.95 18.69,52 L3.1
N$49  (via drill 0.61)
  Top 0.5: v27.39,58.75 27.69,59.05 31.14,59.05 IC1.1 | v25.29,57.25 24.84,57.7 20.49,57.7 19.29,56.5 18.69,56.5 L2.1
  Bottom 0.5: v27.39,58.75 26.79,58.75 v25.29,57.25
N$50  (via drill 0.61)
  Top 0.5: v15.39,43.45 15.54,43.3 16.74,43.3 17.49,42.55 18.84,42.55 19.29,43 19.44,43 19.89,43.45 19.89,46.9 21.09,48.1 30.24,48.1 30.24,49 IC2.1 | v11.79,42.85 9.39,42.85 8.34,43.9 8.34,45.85 | 8.34,45.85 8.34,46.15 10.44,48.25 10.44,52.8 v11.14,53.25 | L3.2 15.39,53.35 15.39,55.15 L2.2 | R25.1 52.89,31.15 51.09,31.15 R24.1 50.79,31.15 50.79,29.8 50.64,29.65 47.49,29.65 v47.04,30.1 | v35.64,28.61 35.49,27.25 35.34,27.1 34.44,27.1 33.24,28.3 29.49,28.3 v28.89,27.7 | v24.39,23.2 21.39,23.2 v20.79,22.6 | v8.79,45.85 8.34,45.85
  Bottom 0.5: v15.39,43.45 12.39,43.45 v11.79,42.85 | v11.14,53.25 13.59,53.25 14.94,55.6 L2.2 15.39,56.5 13.89,58 13.89,61.45 15.09,62.65 L4.1 | v47.04,30.1 46.29,29.35 42.84,29.35 40.74,27.25 36.43,27.24 35.64,28.03 v35.64,28.61 | v24.39,23.2 v28.89,27.7 | C4.+ 21.09,21.55 20.79,21.85 v20.79,22.6 20.49,23.2 14.64,29.05 14.64,31.3 11.34,34.6 9.99,34.6 7.74,36.85 7.74,43.6 8.79,44.65 v8.79,45.85
N$51  (via drill 0.61)
  Top 0.406: IC4.2 53.8,19.5 54.62,20.32 55.96,20.32 56.6,20.97 56.6,21.06 58.14,22.61 | 58.14,22.61 58.18,22.64 | IC3.2 58.14,22.61
  Top 0.5: v29.19,36.55 28.89,36.85 24.09,36.85 23.34,36.1 23.34,34.45 R32.1 | v35.79,37.15 36.69,36.25 v38.94,36.25
  Bottom 0.5: v29.19,36.55 32.04,33.7 32.94,33.7 35.79,36.55 v35.79,37.15 | v38.94,36.25 39.39,36.25 40.89,34.75 47.19,34.75 49.14,36.7 55.89,36.7 58.44,39.25 60.69,39.25 61.59,38.35 61.59,34.3 57.99,30.7 57.99,25.75 58.29,25.45 58.29,24.1 IC3.2
N$52
  Top 0.5: R11.1 45.69,31.15 45.69,29.8 45.54,29.65 41.64,29.65 41.49,29.8 41.49,31.3 Q12.B
N$53  (via drill 0.61)
  Top 0.5: v42.09,55.3 42.09,56.2 42.84,56.95 43.29,56.95 C10.2 | v50.19,47.8 50.19,47.35 50.49,47.05 50.49,43.45 50.04,43 49.74,43 48.54,41.8 48.54,38.35 46.74,36.55 46.74,35.65 45.54,34.45 R11.2 | Q9.2 40.29,9.4 41.64,9.4 41.79,9.25 41.79,5.8 40.44,4.45 Q14.S | v25.14,12.55 25.74,12.55 26.04,12.85 26.04,14.5 Q8.B 25.59,15.7 23.34,17.95 21.09,17.95 19.44,19.6 19.45,19.61 19.45,26.05 v19.31,26.05 | v38.49,63.85 38.94,63.85 39.09,64 IC1.8 39.39,66.7 v41.19,66.7 | v26.19,55.6 22.14,51.55 20.34,51.55 19.74,50.95 18.84,50.95 14.19,46.3 v13.59,46.3
  Bottom 0.5: v50.19,47.8 49.74,48.25 49.14,48.25 v42.09,55.3 42.69,55.6 42.99,55.6 45.39,58 45.39,59.8 41.64,63.55 41.64,66.25 v41.19,66.7 | v25.14,12.55 25.14,6.1 25.09,2.91 25.95,2.05 38.94,2.05 39.84,2.95 Q14.S | v38.49,63.85 37.29,62.65 35.04,62.65 34.29,63.4 33.39,63.4 32.49,62.5 32.49,61.3 26.79,55.6 v26.19,55.6 | v13.59,46.3 11.04,46.3 9.69,44.95 9.69,44.35 8.64,43.3 8.64,37.15 10.29,35.5 11.64,35.5 15.54,31.6 15.54,29.35 18.84,26.05 v19.31,26.05
N$54  (via drill 0.61)
  Top 0.406: IC4.3 52.53,19.92 52.9,20.3 53.2,20.3 53.34,20.44 53.69,20.44 54.3,21.06 54.46,21.38 55.68,22.59 | 55.68,22.59 55.68,22.6 | IC3.3 55.68,22.59
  Top 0.5: v13.29,23.5 17.94,28.15 17.94,31 R31.1 | v7.74,16.6 7.74,11.8 2.09,7.99 2.04,2.83 3.68,1.58 4.68,1.53 4.99,1.51 8.49,1.51 9.24,2.4 18.74,2.4 19.09,2.05 v19.59,2.05 | v22.89,4.3 23.49,4.3 25.29,6.1 25.29,9.7 27.69,12.1 30.69,12.1 v30.99,11.8
  Bottom 0.5: v13.29,23.5 10.59,20.8 10.59,19.45 v7.74,16.6 | v19.59,2.05 20.64,2.05 v22.89,4.3 | v30.99,11.8 30.99,12.25 38.19,19.45 53.04,19.45 54.99,21.4 IC3.3
N$55  (via drill 0.61)
  Top 0.406: IC3.15 47.98,12.46 48.64,11.81 48.64,10.23 48.72,10.15 IC4.15
  Top 0.5: v42.99,3.1 54.84,3.1 55.99,1.7 66.34,1.7 68.77,3.85 68.77,7.7 65.09,10.67 65.04,12.4 R19.2
  Bottom 0.5: v42.99,3.1 42.54,3.55 42.54,8.65 47.49,13.6 IC3.15
N$56  (via drill 0.61)
  Top 0.5: C13.1 67.29,15.1 67.29,13.3 R19.1 67.44,12.35 67.76,12.35 68.05,12.02 v68.05,10.82 | v68.64,25.95 68.64,36.85 66.54,38.95 66.54,39.7 65.79,40.45 60.99,40.45 58.89,38.35 58.89,37.3 60.54,35.65 61.44,35.65 R20.1
  Bottom 0.5: v68.05,10.82 68.05,11.18 68.63,11.76 v68.64,25.95
N$57
  Top 0.406: IC4.11 43.64,10.55 42.56,11.63 40.84,11.63 40.54,11.93 40.17,11.93 38.41,13.69 38.41,14.34 37.81,14.93 37.82,14.95 IC3.11
N$58  (via drill 0.61)
  Top 0.5: D2.C 65.64,37.9 65.64,39.4 65.49,39.55 62.04,39.55 61.89,39.4 61.89,38.05 R20.2 61.44,37.9 v60.24,37.9 | v36.54,25.3 37.29,26.05 C12.2
  Bottom 0.5: v36.54,25.3 37.59,26.35 41.04,26.35 43.14,28.45 48.84,28.45 58.74,38.35 59.79,38.35 v60.24,37.9
N$59  (via drill 0.61)
  Top 0.406: IC3.5 49.99,22.07 IC4.5
  Top 0.5: IC3.5 50.04,23.8 48.99,24.85 41.19,24.85 41.04,25 41.04,26.05 C12.1 40.44,26.05 v39.24,24.85
  Bottom 0.5: v39.24,24.85 40.74,24.85 42.69,26.8 44.19,26.8 XT1.1
N$60  (via drill 0.61)
  Top 0.406: IC4.4 51.26,20.08 52.72,21.54 52.72,22.32 53.06,22.66 | 53.06,22.66 53.11,22.71 | 53.06,22.66 IC3.4
  Top 0.5: XT1.2 49.29,26.8 49.29,25.75 50.19,24.85 51.39,24.85 52.44,23.8 IC3.4 53.64,23.8 53.94,24.1 53.94,26.05 C11.1 53.94,28 53.94,29.05 55.44,30.55 56.94,30.55 57.24,30.25 v59.34,30.25
  Bottom 0.5: v59.34,30.25 60.69,28.15 C1.2
N$61  (via drill 0.61)
  Top 0.5: R32.2 23.34,31.15 23.34,29.65 23.19,29.5 20.49,29.5 20.34,29.65 20.34,31.15 R34.1 19.89,31.9 18.54,33.25 18.24,33.25 R31.2 17.94,34.15 17.94,35.8 17.79,35.95 16.59,35.95 14.04,38.5 14.04,44.95 19.14,50.05 20.04,50.05 20.64,50.65 28.29,50.65 v28.74,50.2 | v34.44,52 35.34,52.9 35.34,55 IC2.12
  Bottom 0.5: v34.44,52 32.64,50.2 v28.74,50.2
N$62
  Top 0.406: IC4.6 48.72,20.2 48.06,20.85 48.06,22.5 IC3.6
N$68
  Top 0.5: Q13.B 30.54,32.35 30.54,36.4 31.44,37.3 33.24,37.3 34.74,35.8 35.34,35.8 35.49,35.65 35.49,34.45 R18.2 35.94,34.3 37.29,34.3 37.29,34.45 37.74,34.45 C14.1 39.54,35.05 39.99,35.05 42.24,37.3 43.59,37.3 44.04,37.75 44.94,37.75 45.84,36.85 45.84,35.95 44.94,35.05 44.79,35.05 44.19,34.45 44.19,33.7 43.44,32.95 43.44,32.5 Q12.E
VCC  (via drill 0.61)
  Top 0.406: IC4.20 56.34,9.8 56.63,9.8 60.45,13.62 60.45,14.7 60.68,14.94 IC3.20
  Top 0.5: R30.1 57.24,4.45 57.24,3.1 56.04,3.1 54.99,4.15 ICSP.2 54.99,5.65 56.19,6.85 56.19,8.2 56.34,8.35 56.34,9.8 | 60.99,18.55 60.99,16.45 IC3.20 | 60.99,18.55 60.99,19.9 62.19,21.1 62.28,21.52 62.79,21.55 67.29,21.55 67.29,20.8 C15.1 | v29.64,62.2 29.04,62.2 26.04,59.2 26.04,58.3 26.94,57.4 27.84,57.4 28.59,58.15 30.24,58.15 30.24,56.95 IC2.16 | IC1.14 31.14,65.2 29.64,65.2 28.44,64 v27.84,64 27.24,64.3 v20.94,64.3 | v29.04,23.05 28.44,23.05 27.54,23.95 27.54,30.7 27.09,31.15 27.09,32.95 26.64,33.4 26.34,33.4 R6.1 25.44,33.55 24.84,32.95 24.84,30.7 24.99,30.55 24.99,28.45 25.74,27.7 25.74,23.35 29.64,19.45 32.19,19.45 33.09,18.55 33.09,17.35 34.74,15.7 35.34,15.7 v35.79,15.25 | v7.29,52.55 7.74,52.1 7.74,49.15 5.64,47.05 5.64,43 10.44,38.2 v10.44,33.25 | v48.84,17.65 55.89,17.65 56.79,18.55 60.99,18.55
  Bottom 0.5: v27.84,64 v29.64,62.2 | C5.+ 30.69,23.05 v29.04,23.05 28.59,22.6 28.59,20.2 24.32,15.92 | 24.32,15.92 22.44,14.05 22.29,14.05 17.34,9.1 7805.OUT | v20.94,64.3 20.34,64.3 18.99,65.65 13.99,65.65 10.29,61.95 10.29,56.4 7.29,53.4 v7.29,52.55 | v10.44,33.25 11.49,33.25 13.74,31 13.74,28.75 19.44,23.05 19.44,20.8 24.32,15.92 | v48.84,17.65 47.94,18.55 38.49,18.55 35.79,15.85 v35.79,15.25
VDD  (via drill 0.61)
  Top 0.5: v24.69,35.5 25.14,35.95 27.99,35.95 28.44,35.5 28.44,34.45 R16.2 | 7809.OUT 16.14,16.45 15.09,17.5 13.74,17.5 12.69,18.55 11.94,18.55 9.84,20.65 9.84,26.48 C6.+ 9.34,29 11.79,31 v11.79,37.75 11.49,38.35 6.54,43.3 6.54,46.75 8.64,48.85 8.64,54.55 9.24,55.15 9.14,63.62 11.34,65.95 11.34,72.85 v12.99,74.5 | v44.49,36.4 42.54,36.4 42.39,36.25 42.39,34.75 Q12.C | v56.94,47.5 57.54,47.5 59.94,49.9 | 59.94,49.9 59.94,50.05 59.19,50.05 Q3.C | v52.29,38.05 51.24,37 49.44,37 48.24,35.8 48.24,34.45 R23.2 | 59.94,49.9 60.39,50.35 60.39,55.3 59.94,55.75 59.19,55.75 R10.1 58.74,56.8 58.74,57.7 60.39,59.35 60.39,65.35 60.09,65.65 59.19,65.65 R8.1 | R21.1 39.09,86.35 42.84,86.35 42.84,85.75 Q6.C 42.54,84.7 v41.19,84.7 | v57.54,67.3 58.14,66.7 58.14,66.1 R8.1 | Q7.C 60.84,84.55 59.19,84.55 58.74,84.1 v58.74,82.15 58.29,81.7 52.59,81.7 52.14,81.25 v51.24,81.25 | R9.1 58.74,63.4 58.74,65.2 R8.1 | v26.79,84.25 26.79,81.7 26.34,81.25 26.34,80.35 27.24,79.45 v30.09,79.45
  Bottom 0.5: v24.69,35.5 23.49,36.7 14.04,36.7 12.99,37.75 v11.79,37.75 | v44.49,36.4 45.24,35.65 46.89,35.65 48.84,37.6 52.29,37.6 | 52.29,37.6 55.59,37.6 59.79,41.8 59.79,44.65 v56.94,47.5 | 52.29,37.6 v52.29,38.05 | v58.74,82.15 57.09,80.5 57.09,67.75 v57.54,67.3 | v41.19,84.7 41.79,84.7 44.04,82.45 44.04,81.25 | 44.04,81.25 45.84,79.45 49.44,79.45 v51.24,81.25 | v12.99,74.5 17.04,78.55 18.69,78.55 20.49,80.35 23.94,80.35 26.79,83.2 v26.79,84.25 | v30.09,79.45 32.34,79.45 32.64,79.75 42.54,79.75 44.04,81.25
(copper drawn outside any net)
  shapes: Bottom area x2, Bottom circle x4, Top area x24, Top circle x4

### Text on the board
Top: Multifunction Composit Video Burst Sync signal processor | Public domain schematics. Layout designed in EU. | 1 | T | G | + | 12 V | -
Bottom: rev.1 0205 | Public domain schematics | Layout designed in EU. | For more test patterns contact reseller. | Processor | Multifunction CVBS | T | G | 12 V | + | -
tPlace: 2 | 20 | 1 | 21 | Processor | Multifunction CVBS | 2 | 20 | 1 | 21 | Multifunction Composit Video Burst Sync signal processor | Public domain schematics. Layout designed in EU. | 1 | T | G | 12 V | + | -